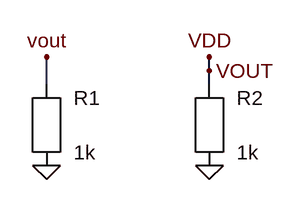
[diagram p0: schematic label_case_second_name.asc]
label_case_second_name.asc, the LTspice schematic file:
Version 4
SHEET 1 880 680
WIRE 96 96 96 64
WIRE 288 96 288 64
FLAG 96 64 vout
FLAG 288 64 VDD
FLAG 288 80 VOUT
FLAG 96 192 0
FLAG 288 192 0
SYMBOL res 96 144 R0
SYMATTR InstName R1
SYMATTR Value 1k
SYMBOL res 288 144 R0
SYMATTR InstName R2
SYMATTR Value 1k

The netlist it stands for:
* label_case_second_name.asc
R1 VDD 0 1k
R2 VDD 0 1k
.backanno
.end